# Altium project HDMI_To_FPCadaptor_V1.0.PrjPcb (part 1 of 2)
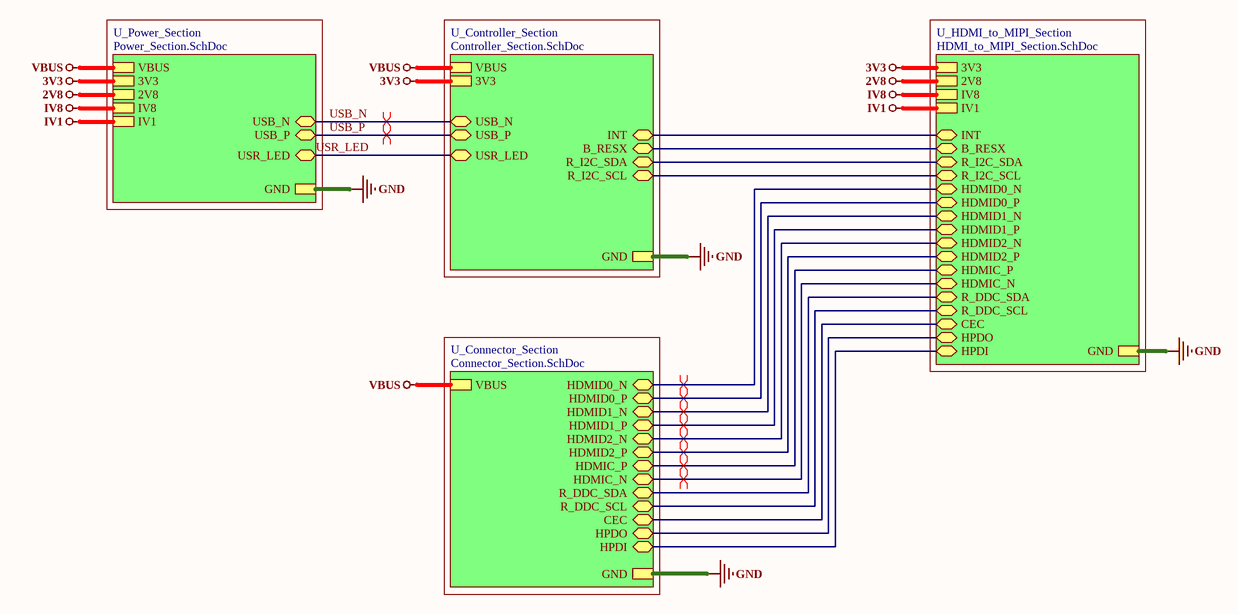
[diagram p0: Top_Sheet.SchDoc]
5 sheets, 121 parts. Net scope: hierarchical (ports join the sheet entries above them; power ports are global).
Board file: PCB_HDMI_To_FPC-v1.0.PcbDoc
Sheets:
  Top_Sheet.SchDoc
    U_Power_Section = Power_Section.SchDoc
    U_Connector_Section = Connector_Section.SchDoc
    U_Controller_Section = Controller_Section.SchDoc
    U_HDMI_to_MIPI_Section = HDMI_to_MIPI_Section.SchDoc

## Sheet Top_Sheet.SchDoc
size A4; SheetNumber: 1; SheetTotal: 5

### Sub-sheets
U_Connector_Section = Connector_Section.SchDoc: HDMID0_N (bidir), HDMID0_P (bidir), HDMID1_N (bidir), HDMID1_P (bidir), HDMID2_N (bidir), HDMID2_P (bidir), HDMIC_P (bidir), HDMIC_N (bidir), R_DDC_SDA (bidir), R_DDC_SCL (bidir), CEC (bidir), HPDO (bidir), HPDI (bidir), VBUS, GND
U_Controller_Section = Controller_Section.SchDoc: USB_N (bidir), USB_P (bidir), USR_LED (bidir), INT (bidir), B_RESX (bidir), R_I2C_SDA (bidir), R_I2C_SCL (bidir), 3V3, VBUS, GND
U_HDMI_to_MIPI_Section = HDMI_to_MIPI_Section.SchDoc: 3V3, GND, IV8, IV1, 2V8, INT (bidir), B_RESX (bidir), R_I2C_SDA (bidir), R_I2C_SCL (bidir), HDMID0_N (bidir), HDMID0_P (bidir), HDMID1_N (bidir), HDMID1_P (bidir), HDMID2_N (bidir), HDMID2_P (bidir), HDMIC_P (bidir), HDMIC_N (bidir), R_DDC_SDA (bidir), R_DDC_SCL (bidir), CEC (bidir), HPDO (bidir), HPDI (bidir)
U_Power_Section = Power_Section.SchDoc: 3V3, GND, VBUS, IV8, IV1, 2V8, USB_N (bidir), USB_P (bidir), USR_LED (bidir)

### Nets
2V8: sheet U_Power_Section/2V8, sheet U_HDMI_to_MIPI_Section/2V8
3V3: sheet U_Power_Section/3V3, sheet U_Controller_Section/3V3, sheet U_HDMI_to_MIPI_Section/3V3
GND: sheet U_Power_Section/GND, sheet U_Connector_Section/GND, sheet U_Controller_Section/GND, sheet U_HDMI_to_MIPI_Section/GND
IV1: sheet U_Power_Section/IV1, sheet U_HDMI_to_MIPI_Section/IV1
IV8: sheet U_Power_Section/IV8, sheet U_HDMI_to_MIPI_Section/IV8
VBUS: sheet U_Power_Section/VBUS, sheet U_Connector_Section/VBUS, sheet U_Controller_Section/VBUS
B_RESX: sheet U_Controller_Section/B_RESX, sheet U_HDMI_to_MIPI_Section/B_RESX
CEC: sheet U_Connector_Section/CEC, sheet U_HDMI_to_MIPI_Section/CEC
HDMIC_N: sheet U_Connector_Section/HDMIC_N, sheet U_HDMI_to_MIPI_Section/HDMIC_N
HDMIC_P: sheet U_Connector_Section/HDMIC_P, sheet U_HDMI_to_MIPI_Section/HDMIC_P
HDMID0_N: sheet U_Connector_Section/HDMID0_N, sheet U_HDMI_to_MIPI_Section/HDMID0_N
HDMID0_P: sheet U_Connector_Section/HDMID0_P, sheet U_HDMI_to_MIPI_Section/HDMID0_P
HDMID1_N: sheet U_Connector_Section/HDMID1_N, sheet U_HDMI_to_MIPI_Section/HDMID1_N
HDMID1_P: sheet U_Connector_Section/HDMID1_P, sheet U_HDMI_to_MIPI_Section/HDMID1_P
HDMID2_N: sheet U_Connector_Section/HDMID2_N, sheet U_HDMI_to_MIPI_Section/HDMID2_N
HDMID2_P: sheet U_Connector_Section/HDMID2_P, sheet U_HDMI_to_MIPI_Section/HDMID2_P
HPDI: sheet U_Connector_Section/HPDI, sheet U_HDMI_to_MIPI_Section/HPDI
HPDO: sheet U_Connector_Section/HPDO, sheet U_HDMI_to_MIPI_Section/HPDO
INT: sheet U_Controller_Section/INT, sheet U_HDMI_to_MIPI_Section/INT
R_DDC_SCL: sheet U_Connector_Section/R_DDC_SCL, sheet U_HDMI_to_MIPI_Section/R_DDC_SCL
R_DDC_SDA: sheet U_Connector_Section/R_DDC_SDA, sheet U_HDMI_to_MIPI_Section/R_DDC_SDA
R_I2C_SCL: sheet U_Controller_Section/R_I2C_SCL, sheet U_HDMI_to_MIPI_Section/R_I2C_SCL
R_I2C_SDA: sheet U_Controller_Section/R_I2C_SDA, sheet U_HDMI_to_MIPI_Section/R_I2C_SDA
USB_N: sheet U_Power_Section/USB_N, sheet U_Controller_Section/USB_N
USB_P: sheet U_Power_Section/USB_P, sheet U_Controller_Section/USB_P
USR_LED: sheet U_Power_Section/USR_LED, sheet U_Controller_Section/USR_LED

### Layout directives
differential pair; net class USB; differential pair class USB_Lines; rule Impedance Constraint [Min = 85.00    Max = 90.00    ]; rule Matched Net Lengths [Tolerance = 50mil]: USB_N, USB_P
differential pair; net class HDMI; differential pair class HDMI_Lines; rule Impedance Constraint [Min = 95.00    Max = 100.0    ]; rule Matched Net Lengths [Tolerance = 5mil]: HDMIC_N, HDMIC_P, HDMID0_N, HDMID0_P, HDMID1_N, HDMID1_P, HDMID2_N, HDMID2_P

### Notes on the sheet
- File:
- Title:
- Date:
- Page
- Num:
- Total:
- Drawn By: Huzaifa Ali

## Sheet Power_Section.SchDoc
size A4; SheetNumber: 2; SheetTotal: 5
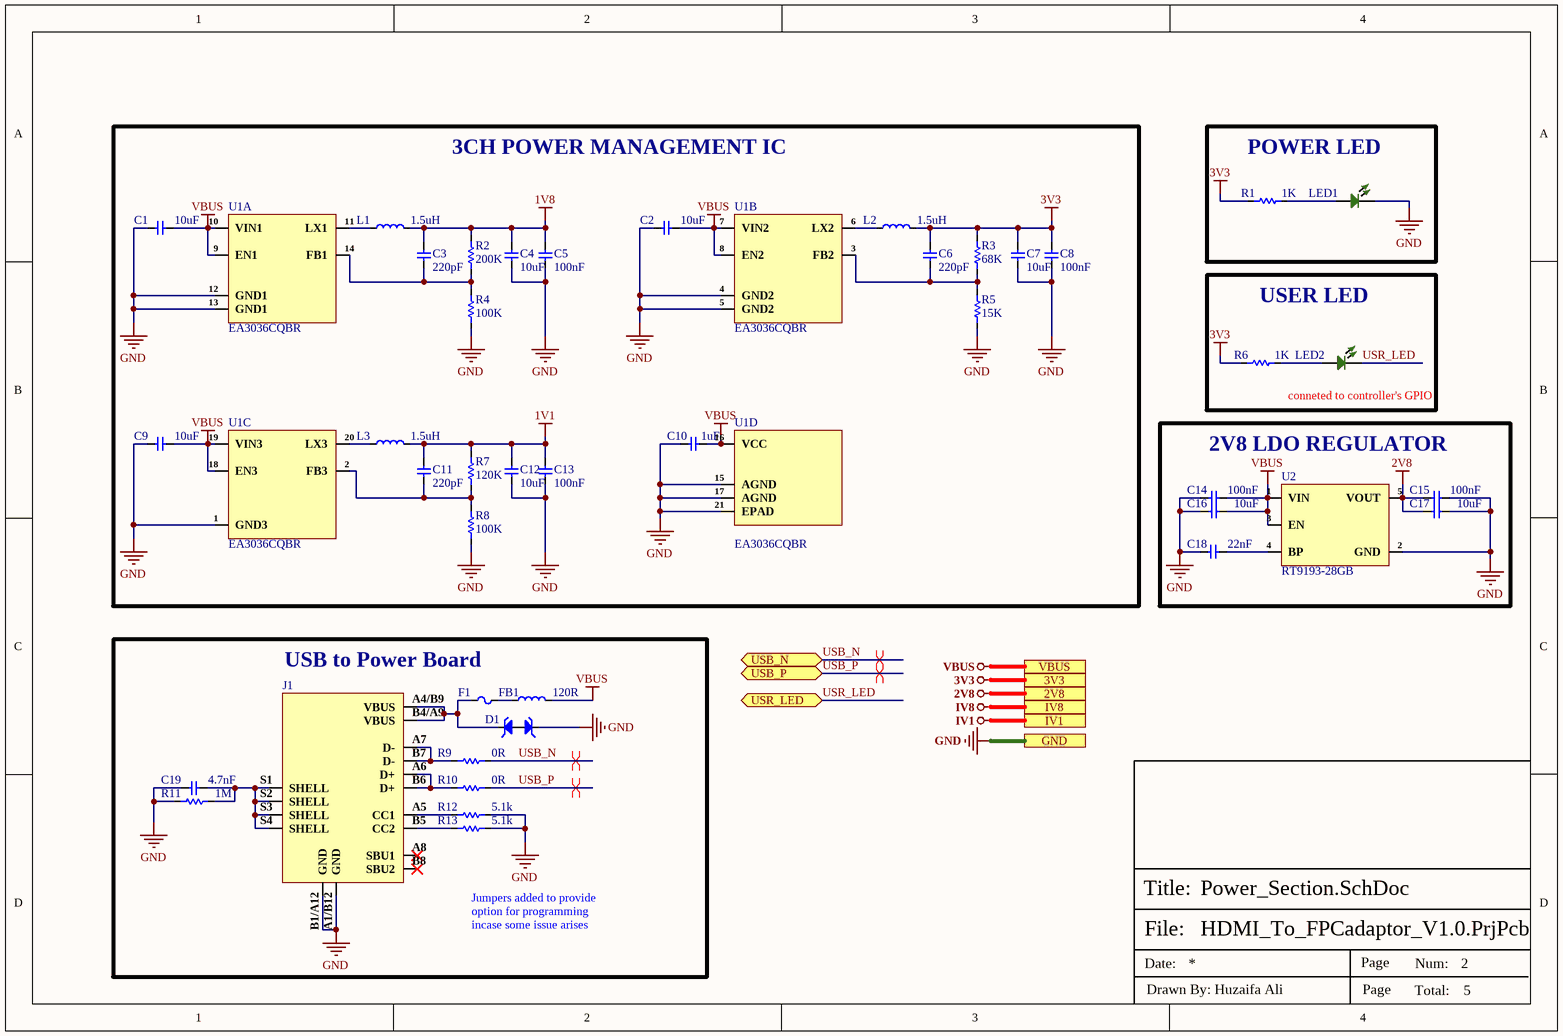
[diagram p1: Power_Section.SchDoc]

### Parts
C1  10uF  [Cap-0603]
C2  10uF  [Cap-0603]
C3  220pF  [Cap-0603]
C4  10uF  [Cap-0603]
C5  100nF  [Cap-0603]
C6  220pF  [Cap-0603]
C7  10uF  [Cap-0603]
C8  100nF  [Cap-0603]
C9  10uF  [Cap-0603]
C10  1uF  [Cap-0603]
C11  220pF  [Cap-0603]
C12  10uF  [Cap-0603]
C13  100nF  [Cap-0603]
C14  100nF  [Cap-0603]
C15  100nF  [Cap-0603]
C16  10uF  [Cap-0603]
C17  10uF  [Cap-0603]
C18  22nF  [Cap-0603]
C19  4.7nF  [Cap-0603]
D1  PESD5V0H1BSFYL  [DSN0603-2]  (value not drawn)
F1  1206L300SLTHYR  [Fuse 1206 (3216 Metric)]  (value not drawn)
FB1  120R  [IND-0603 (1608 Metric)]
J1  TYPE-C-31-M-12  [TYPE-C-31-M-12_]  (value not drawn)
L1  1.5uH  [IND-1008 (2520 Metric)]
L2  1.5uH  [IND-1008 (2520 Metric)]
L3  1.5uH  [IND-1008 (2520 Metric)]
LED1  Green  [LED-0402]  (value not drawn)
LED2  Green  [LED-0402]  (value not drawn)
R1  1K  [Res-0603]
R2  200K  [Res-0603]
R3  68K  [RES-0603]
R4  100K  [Res-0603]
R5  15K  [RES-0603]
R6  1K  [Res-0603]
R7  120K  [RES-0603]
R8  100K  [Res-0603]
R9  0R  [Res-0603]
R10  0R  [Res-0603]
R11  1M  [Res-0603]
R12  5.1k  [Res-0603]
R13  5.1k  [Res-0603]
U1  EA3036CQBR  [20-QFN(3x3)]  (parts A,B,C,D of 4)
U2  RT9193-28GB  [SOT-23-5]

### Blocks framed on the sheet
3CH POWER MANAGEMENT IC: C1-C13 L1-L3 R2-R5 R7 R8 U1
POWER LED: LED1 R1
USER LED: LED2 R6
2V8 LDO REGULATOR: C14-C18 U2
USB to Power Board: C19 D1 F1 FB1 J1 R9-R13

### Ports
2V8 (see Top_Sheet[1B], HDMI_to_MIPI_Section[1D]), 3V3 (see Top_Sheet[1B], Controller_Section[1D], HDMI_to_MIPI_Section[1D]), GND (see Top_Sheet[2B], Connector_Section[3C], Controller_Section[1D], HDMI_to_MIPI_Section[1D]), IV1 (see Top_Sheet[1B], HDMI_to_MIPI_Section[1D]), IV8 (see Top_Sheet[1B], HDMI_to_MIPI_Section[1D]), USB_N (bidir, see Top_Sheet[2B], Controller_Section[1C]), USB_P (bidir, see Top_Sheet[2B], Controller_Section[1C]), USR_LED (bidir, see Top_Sheet[2B], Controller_Section[1D]), VBUS (see Top_Sheet[1B], Connector_Section[3C], Controller_Section[1D])

### Nets
1V1: C11.2 C12.2 C13.2 L3.2 R7.2
1V8: C3.2 C4.2 C5.2 L1.2 R2.2
2V8: C15.2 C17.2 U2.5(VOUT) ; port 2V8
3V3: C6.2 C7.2 C8.2 L2.2 R1.1 R3.2 R6.1 ; port 3V3
GND: C1.1 C2.1 C4.1 C5.1 C7.1 C8.1 C9.1 C10.1 C12.1 C13.1 C14.2 C15.1 C16.2 C17.1 C18.1 C19.1 D1.2 J1.A1/B12(GND) J1.B1/A12(GND) LED1.2 R4.1 R5.1 R8.1 R11.1 R12.2 R13.2 U1.1(GND3) U1.4(GND2) U1.5(GND2) U1.12(GND1) U1.13(GND1) U1.15(AGND) U1.17(AGND) U1.21(EPAD) U2.2(GND) ; port GND
VBUS: C1.2 C2.2 C9.2 C10.2 C14.1 C16.1 FB1.2 U1.7(VIN2) U1.8(EN2) U1.9(EN1) U1.10(VIN1) U1.16(VCC) U1.18(EN3) U1.19(VIN3) U2.1(VIN) U2.3(EN) ; port VBUS
USB_N: R9.2 ; port USB_N
USB_P: R10.2 ; port USB_P
USR_LED: LED2.2 ; port USR_LED
NetC3_1: C3.1 R2.1 R4.2 U1.14(FB1)
NetC6_1: C6.1 R3.1 R5.2 U1.3(FB2)
NetC11_1: C11.1 R7.1 R8.2 U1.2(FB3)
NetC18_2: C18.2 U2.4(BP)
NetC19_2: C19.2 J1.S1(SHELL) J1.S2(SHELL) J1.S3(SHELL) J1.S4(SHELL) R11.2
NetD1_1: D1.1 F1.1 J1.A4/B9(VBUS) J1.B4/A9(VBUS)
NetF1_2: F1.2 FB1.1
NetJ1_A5: J1.A5(CC1) R12.1
NetJ1_A6: J1.A6(D+) J1.B6(D+) R10.1
NetJ1_A7: J1.A7(D-) J1.B7(D-) R9.1
NetJ1_B5: J1.B5(CC2) R13.1
NetL1_1: L1.1 U1.11(LX1)
NetL2_1: L2.1 U1.6(LX2)
NetL3_1: L3.1 U1.20(LX3)
NetLED1_1: LED1.1 R1.2
NetLED2_1: LED2.1 R6.2

Not connected (* = marked no-connect by the designer): J1 A8(SBU1)* B8(SBU2)*

### Layout directives
differential pair; net class USB; differential pair class USB_Lines; rule Impedance Constraint [Min = 85.00    Max = 90.00    ]; rule Matched Net Lengths [Tolerance = 50mil]: USB_N, USB_P

### Notes on the sheet
- conneted to controller's GPIO
- Jumpers added to provide option for programming incase some issue arises
- File:
- Title:
- Date:
- Page
- Num:
- Total:
- Drawn By: Huzaifa Ali

### Library data of the parts
C1 C2 C4 C7 C9 C12 C16 C17 = CGA0603X5R106K100JT: 10V 10uF X5R ±10% 0603 Multilayer Ceramic Capacitors MLCC - SMD/SMT ROHS; Manufacturer: HRE; ComponentLink1Description: LCSC; ComponentLink1URL: https://www.lcsc.com/product-detail/Multilayer-Ceramic-Capacitors-MLCC-SMD-SMT_HRE-CGA0603X5R106K100JT_C6119842.html; Manufacturer Part Number: CGA0603X5R106K100JT; Package: 0603; LCSC Part Number: C6119842; Item Type: Capacitor
C3 C6 C11 = CS1608X7R221K500NRB: 50V 220pF X7R ±10% 0603 Multilayer Ceramic Capacitors MLCC - SMD/SMT ROHS; Manufacturer: Samwha Capacitors; Manufacturer Part Number: CS1608X7R221K500NRB; Package: 0603; LCSC Part Number: C5255295; Item Type: Capacitor; ComponentLink1Description: LCSC; ComponentLink1URL: https://www.lcsc.com/product-detail/Multilayer-Ceramic-Capacitors-MLCC-SMD-SMT_Samwha-Capacitor-CS1608X7R221K500NRB_C5255295.html
C5 C8 C13-C15 = CL10B104KA8NNNC: 25V 100nF X7R ±10% 0603 Multilayer Ceramic Capacitors MLCC - SMD/SMT ROHS; Manufacturer: Samsung Electro-Mechanics; ComponentLink1Description: LCSC; ComponentLink1URL: https://www.lcsc.com/product-detail/Multilayer-Ceramic-Capacitors-MLCC-SMD-SMT_Samsung-Electro-Mechanics-CL10B104KA8NNNC_C1590.html; Manufacturer Part Number: CL10B104KA8NNNC; Package: 0603; LCSC Part Number: C1590; Item Type: Capacitor
C10 = CL10A105KO8NNNC: 16V 1uF X5R ±10% 0603 Multilayer Ceramic Capacitors MLCC - SMD/SMT ROHS; Manufacturer: Samsung Electro-Mechanics; Manufacturer Part Number: CL10A105KO8NNNC; Package: 0603; LCSC Part Number: C1592; Item Type: Capacitor; ComponentLink1Description: LCSC; ComponentLink1URL: https://www.lcsc.com/product-detail/Multilayer-Ceramic-Capacitors-MLCC-SMD-SMT_Samsung-Electro-Mechanics-CL10A105KO8NNNC_C1592.html
C18 = FN18X223K250PSG: 25V 22nF X7R 0603 Multilayer Ceramic Capacitors MLCC - SMD/SMT ROHS; Manfacuturer: PSA; Manufacturer Prt no: FN18X223K250PSG; Package: 0603; Value: 22nF; ComponentLink1Description: LCSC; ComponentLink1URL: https://www.lcsc.com/product-detail/Multilayer-Ceramic-Capacitors-MLCC-SMD-SMT_PSA-Prosperity-Dielectrics-FN18X223K250PSG_C2929161.html; Item Type: Capacitor; LCSC Part no: C2929161
C19 = CC0603JRNPO9BN472: CAP CER 4700PF 50V C0G/NPO 0603; Manufacturer: Yageo; Item Type: Capacitor; Supplier 1: Digi-Key; Manufacturer Part Number: CC0603JRNPO9BN472; RoHS: Yes; Category: Ceramic Capacitors; Stock 1: 31779; Pricing 1: 1=0.48000, 10=0.33000, 50=0.23100, 100=0.19800, 500=0.14854, 1000=0.12543 (USD); RoHS Compliant: Yes; Supplier Part Number 1: 13-CC0603JRNPO9BN472CT-ND; LCSC Part Number: C576818; ComponentLink1Description: LCSC; ComponentLink1URL: https://www.lcsc.com/product-detail/Multilayer-Ceramic-Capacitors-MLCC-SMD-SMT_YAGEO-CC0603JRNPO9BN472_C576818.html
D1 = PESD5V0H1BSFYL: TVS DIODE 5VWM 6.3VC DSN0603-2; Manufacturer: Nexperia; Supplier 1: Avnet; Manufacturer Part Number: PESD5V0H1BSFYL; RoHS: Yes; Category: ESD and Circuit Protection ICs; Stock 1: 9000; Pricing 1: 18000=0.06453, 36000=0.06278, 54000=0.06104, 90000=0.05930, 180000=0.05755, 900000=0.05581, 1800000=0.05406 (USD); RoHS Compliant: Yes; ComponentLink1URL: http://www.farnell.com/datasheets/1961312.pdf?src-supplier=Farnell; ComponentLink1Description: http://www.farnell.com/datasheets/1961312.pdf?src-supplier=Farnell; ComponentLink2URL: https://assets.nexperia.com/documents/data-sheet/PESD5V0H1BSF.pdf?src-supplier=Digi-Key; ComponentLink2Description: https://assets.nexperia.com/documents/data-sheet/PESD5V0H1BSF.pdf?src-supplier=Digi-Key; ComponentLink3URL: http://www.farnell.com/datasheets/1961312.pdf?src-supplier=Newark; ComponentLink3Description: http://www.farnell.com/datasheets/1961312.pdf?src-supplier=Newark; Supplier Part Number 1: PESD5V0H1BSFYL; LCSC Part Number: C477989; Item Type: Diode
F1 = 1206L300SLTHYR: PTC RESET FUSE 6V 3A 1206; Manufacturer: Littelfuse; Max Current Rating: 50A; Resistance: 20mR; Power Dissipation: 800mW; Trip Current: 6A; Time to Trip: 4s; Approvals: UL,TUV; Supplier 1: Arrow Electronics; Manufacturer Part Number: 1206L300SLTHYR; RoHS: Yes; Category: PTC Resettable Fuses; Stock 1: 4000; Pricing 1: 4000=0.60290 (USD); Case/Package: 1206; Case Code (Metric): 3216; Case Code (Imperial): 1206; Min Operating Temperature: -40°C; Max Operating Temperature: 85°C; Package Quantity: 4000; Packaging: Tape and Reel; Termination: SMD/SMT; Max Voltage Rating (DC): 6V; Hold Current: 3A; Voltage Rating (DC): 6V; Operating Supply Voltage: 6V; Series: POLY-FUSE®, LoRho™; Lead Free: Lead Free; RoHS Compliant: Yes; ComponentLink1URL: https://datasheet.ciiva.com/7438/littelfuse-lorho-ptc-7438567.pdf?src-supplier=Digi-Key; ComponentLink1Description: https://datasheet.ciiva.com/7438/littelfuse-lorho-ptc-7438567.pdf?src-supplier=Digi-Key; ComponentLink2URL: https://datasheet.ciiva.com/7438/littelfuse-lorho-ptc-7438569.pdf?src-supplier=Digi-Key; ComponentLink2Description: https://datasheet.ciiva.com/7438/littelfuse-lorho-ptc-7438569.pdf?src-supplier=Digi-Key; ComponentLink3URL: https://datasheet.ciiva.com/7438/littelfuse-lorho-ptc-7438565.pdf?src-supplier=Digi-Key; ComponentLink3Description: https://datasheet.ciiva.com/7438/littelfuse-lorho-ptc-7438565.pdf?src-supplier=Digi-Key; Supplier Part Number 1: 1206L300SLTHYR; LCSC Part Number: C207041; Item Type: Fuse
FB1 = BLM18PG121SN1D: Ferrite Beads Multi-Layer 120Ohm 25% 100MHz 2A 50mOhm DCR 0603 Paper T/R; Manufacturer: Murata Electronics; Material: Steel,Ferrite; Number of Lines: 1; DC Resistance (DCR): 50mR; Shielding: Unshielded; Manufacturer Part Number: BLM18PG121SN1D; Package: 0603; LCSC Part Number: C14709; Item Type: Ferrite Bead; ComponentLink1Description: LCSC; ComponentLink1URL: https://www.lcsc.com/product-detail/Ferrite-Beads_Murata-Electronics-BLM18PG121SN1D_C14709.html; Supplier: Digikey; Supplier Part Number: 490-1037-1-ND; RoHS: Yes; Category: Ferrite Beads and Chips; Stock: 1240; Pricing: 1=0.1, 10=0.078, 25=0.0712, 50=0.064, 100=0.0469, 250=0.03412, 500=0.03128, 1000=0.02701 (USD); Case/Package: 0603; Pins: 2; Core Material: Ferrite; Case Code (Metric): 1608; Case Code (Imperial): 0603; Min Operating Temperature: -55°C; Max Operating Temperature: 125°C; Tolerance: 25%; Impedance: 120R; Package Quantity: 1; Max Current Rating: 2A; Packaging: Tape and Reel; Current Rating: 2A; Max DC Current: 2A; Termination: SMD/SMT; Test Frequency: 100MHz; DC Current: 2A; Frequency: 100MHz; Number of Circuits: 1; Series: BLM18P; DC Resistance-Max: 50mR; RMS Current (Irms): 2A; ESR: 50mR; Length: 1.6mm; Width: 0.8mm; Height: 0.8mm; Depth: 0.8mm; Radiation Hardening: No; Reach SVHC Compliant: No; Lead Free: Lead Free; RoHS Compliant: Yes; ComponentLink2URL: https://datasheet.ciiva.com/5709/1740433-5709171.pdf?src-supplier=Farnell; ComponentLink2Description: https://datasheet.ciiva.com/5709/1740433-5709171.pdf?src-supplier=Farnell; ComponentLink3URL: https://datasheet.ciiva.com/19454/1845013-19454715.pdf?src-supplier=Jameco; ComponentLink3Description: https://datasheet.ciiva.com/19454/1845013-19454715.pdf?src-supplier=Jameco; ComponentLink4URL: https://datasheet.ciiva.com/11799/0900766b81275ca5-11799546.pdf?src-supplier=Rs; ComponentLink4Description: https://datasheet.ciiva.com/11799/0900766b81275ca5-11799546.pdf?src-supplier=Rs; ComponentLink5URL: https://datasheet.ciiva.com/3854/5emiapbde-1-3854039.pdf?src-supplier=Arrow+Electronics; ComponentLink5Description: https://datasheet.ciiva.com/3854/5emiapbde-1-3854039.pdf?src-supplier=Arrow+Electronics; ComponentLink6URL: https://datasheet.ciiva.com/29347/442365-da-01-en-chip-drossel-0603-120r-2000ma-1-6x0-8mm-29347911.pdf?src-supplier=Conrad; ComponentLink6Description: https://datasheet.ciiva.com/29347/442365-da-01-en-chip-drossel-0603-120r-2000ma-1-6x0-8mm-29347911.pdf?src-supplier=Conrad; ComponentLink7URL: https://datasheet.ciiva.com/8021/1740433-8021493.pdf?src-supplier=Element14; ComponentLink7Description: https://datasheet.ciiva.com/8021/1740433-8021493.pdf?src-supplier=Element14; ComponentLink8URL: https://datasheet.ciiva.com/8021/1740433-8021494.pdf?src-supplier=Element14; ComponentLink8Description: https://datasheet.ciiva.com/8021/1740433-8021494.pdf?src-supplier=Element14; ComponentLink9URL: https://datasheet.ciiva.com/14122/blm-series-eng-tds-14122905.pdf?src-supplier=Distrelec; ComponentLink9Description: https://datasheet.ciiva.com/14122/blm-series-eng-tds-14122905.pdf?src-supplier=Distrelec; ComponentLink10URL: https://datasheet.ciiva.com/6212/l0110s0100blm18p-6212502.pdf?src-supplier=Digikey; ComponentLink10Description: https://datasheet.ciiva.com/6212/l0110s0100blm18p-6212502.pdf?src-supplier=Digikey; ComponentLink11URL: https://datasheet.ciiva.com/6212/l0110s0100blm18p-6212504.pdf?src-supplier=Digikey; ComponentLink11Description: https://datasheet.ciiva.com/6212/l0110s0100blm18p-6212504.pdf?src-supplier=Digikey; ComponentLink12URL: https://datasheet.ciiva.com/3081/l0110s0100blm18p-3081632.pdf?src-supplier=Avnet; ComponentLink12Description: https://datasheet.ciiva.com/3081/l0110s0100blm18p-3081632.pdf?src-supplier=Avnet; ComponentLink13URL: https://datasheet.ciiva.com/41449/001172297-da-01-en-drossel-0603-120r-1-6x0-8mm-4000st-41449659.pdf?src-supplier=Conrad; ComponentLink13Description: https://datasheet.ciiva.com/41449/001172297-da-01-en-drossel-0603-120r-1-6x0-8mm-4000st-41449659.pdf?src-supplier=Conrad
J1 = TYPE-C-31-M-12: 5A 1 16P Female Type-C SMD USB Connectors ROHS /; Manufacturer: Korean Hroparts Elec; ComponentLink1Description: LCSC; ComponentLink1URL: https://www.lcsc.com/product-detail/USB-Connectors_Korean-Hroparts-Elec-TYPE-C-31-M-12_C165948.html; Manufacturer Part Number: TYPE-C-31-M-12; Footprint: Custom; LCSC Part Number: C165948; Item Type: USB Connector
L1-L3 = LQM2HPN1R5MG0L: Inductor Power Chip Shielded Multi-Layer 1.5uH 20% 1MHz Ferrite 1.5A 0.088Ohm DCR 1008 T/R; Manufacturer: Murata Electronics; Self Resonant Frequency: 50MHz; DC Resistance (DCR): 88mR; Manufacturer Part Number: LQM2HPN1R5MG0L; Package: 1008; LCSC Part Number: C98034; Item Type: Inductor; ComponentLink1Description: LCSC; ComponentLink1URL: https://www.lcsc.com/product-detail/Inductors-SMD_Murata-Electronics-LQM2HPN1R5MG0L_C98034.html; Supplier: Digikey; Supplier Part Number: 490-5113-1-ND; RoHS: Yes; Category: Fixed Inductors; Stock: 55189; Pricing: 1=0.21, 10=0.171, 25=0.1576, 50=0.1444, 100=0.1274, 250=0.12344, 500=0.11032, 1000=0.0893 (USD); Mounting Technology: Surface Mount; Case/Package: 1008; Core Material: Ferrite; Case Code (Metric): 2520; Case Code (Imperial): 1008; Min Operating Temperature: -55°C; Max Operating Temperature: 125°C; Tolerance: 20%; Packaging: Tape and Reel; Shielding: Shielded; Package Quantity: 1; Current Rating: 1.5A; Value: 1.5uH; Test Frequency: 1MHz; Max DC Current: 1.5A; Termination: SMD/SMT; DC Current: 1.5A; Inductance Tolerance: 20%; Series: LQM2HP_G0; RMS Current (Irms): 1.5A; ESR: 88mR; Length: 2.5mm; Width: 0.079inch; Height: 1.2mm; Height - Seated (Max): 0.039inch; Depth: 2.2mm; Radiation Hardening: No; Military Standard: Not; Reach SVHC Compliant: No; Lead Free: Lead Free; RoHS Compliant: Yes; ComponentLink2URL: https://datasheet.ciiva.com/30490/0900766b812561d9-30490182.pdf?src-supplier=Rs; ComponentLink2Description: https://datasheet.ciiva.com/30490/0900766b812561d9-30490182.pdf?src-supplier=Rs; ComponentLink3URL: https://datasheet.ciiva.com/1042/l0075s0104lqm2hp-g0-1042938.pdf?src-supplier=Digikey; ComponentLink3Description: https://datasheet.ciiva.com/1042/l0075s0104lqm2hp-g0-1042938.pdf?src-supplier=Digikey; ComponentLink4URL: https://datasheet.ciiva.com/1042/l0075s0104lqm2hp-g0-1042937.pdf?src-supplier=Digikey; ComponentLink4Description: https://datasheet.ciiva.com/1042/l0075s0104lqm2hp-g0-1042937.pdf?src-supplier=Digikey; ComponentLink5URL: https://datasheet.ciiva.com/1042/l0075s0104lqm2hp-g0-1042939.pdf?src-supplier=Digikey; ComponentLink5Description: https://datasheet.ciiva.com/1042/l0075s0104lqm2hp-g0-1042939.pdf?src-supplier=Digikey; ComponentLink6URL: https://datasheet.ciiva.com/8510/l0075s0104lqm2hp-g0-8510490.pdf?src-supplier=Avnet; ComponentLink6Description: https://datasheet.ciiva.com/8510/l0075s0104lqm2hp-g0-8510490.pdf?src-supplier=Avnet
LED1 LED2 = 16-213/GHC-YR1S1/3T: Green 520~535nm 0402 Light Emitting Diodes (LED) RoHS; Manufacturer: Everlight Elec; Luminous Intensity (IF=20mA): 112~285mcd; Package: 0402; Illumination Color: Green; Dominant Wavelength / Coordinate rank: 520~535nm; Mounting Type: Surface Mount; Manufacturer Part Number: 16-213/GHC-YR1S1/3T; ComponentLink1Description: LCSC; ComponentLink1URL: https://www.lcsc.com/product-detail/Light-Emitting-Diodes-LED_Everlight-Elec-16-213-GHC-YR1S1-3T_C74338.html; LCSC Part Number: C74338; Item Type: LED
R1 R6 = RC0603FR-071KL: RES SMD 1K OHM 1% 1/10W 0603; Manufacturer: Yageo; Resistance: 1kR; Temperature Coefficient: 100ppm/°C; Power Rating: 100mW; Voltage Rating: 50V; Item type: Resistor; ComponentLink1URL: https://www.verical.com/server-webapp/html/getDatasheet?partID=409289&src-supplier=Verical; ComponentLink1Description: https://www.verical.com/server-webapp/html/getDatasheet?partID=409289&src-supplier=Verical; Supplier 1: Digi-Key; Manufacturer Part Number: RC0603FR-071KL; Stock 1: 21472395; Pricing 1: 1=0.1, 10=0.023, 100=0.0094, 1000=0.0042, 2500=0.0037 (USD); Case/Package: 0603; Contact Plating: Tin,Matte; Case Code (Imperial): 0603; Case Code (Metric): 1608; Min Operating Temperature: -55°C; Max Operating Temperature: 155°C; Tolerance: 1%; Composition: Thick Film; Packaging: Tape and Reel; Termination: SMD/SMT; Military Standard: Not; Length: 1.6mm; Height: 0.45mm; Depth: 0.8mm; Radiation Hardening: No; REACH SVHC: No SVHC; Lead Free: Lead Free; ComponentLink2URL: http://documents.rs-components.com/techlib://itc_doclist_GB.htm?stockno=5048928&src-supplier=RSComponents; ComponentLink2Description: http://documents.rs-components.com/techlib://itc_doclist_GB.htm?stockno=5048928&src-supplier=RSComponents; ComponentLink3URL: http://www.yageo.com/documents/recent/PYu-RC0603_51_RoHS_L_4.pdf?src-supplier=Avnet+Europe; ComponentLink3Description: http://www.yageo.com/documents/recent/PYu-RC0603_51_RoHS_L_4.pdf?src-supplier=Avnet+Europe; ComponentLink4URL: http://www.farnell.com/datasheets/2167052.pdf?src-supplier=Element14; ComponentLink4Description: http://www.farnell.com/datasheets/2167052.pdf?src-supplier=Element14; ComponentLink5URL: http://www.farnell.com/datasheets/1868787.pdf?src-supplier=Element14; ComponentLink5Description: http://www.farnell.com/datasheets/1868787.pdf?src-supplier=Element14; ComponentLink6URL: http://www.yageo.com/documents/recent/PYu-RC_Group_51_RoHS_L_2.pdf?src-supplier=Avnet; ComponentLink6Description: http://www.yageo.com/documents/recent/PYu-RC_Group_51_RoHS_L_2.pdf?src-supplier=Avnet; ComponentLink7URL: https://www.verical.com/server-webapp/html/getDatasheet?partID=404327&src-supplier=Verical; ComponentLink7Description: https://www.verical.com/server-webapp/html/getDatasheet?partID=404327&src-supplier=Verical; ComponentLink8URL: http://www.farnell.com/datasheets/443971.pdf?src-supplier=Element14; ComponentLink8Description: http://www.farnell.com/datasheets/443971.pdf?src-supplier=Element14; Supplier Part Number 1: 311-1.00KHRDKR-ND; LCSC Part Number: C22548
R2 = 0603WAF2003T5E: 100mW Thick Film Resistors 75V ±100ppm/℃ ±1% 200kΩ 0603 Chip Resistor - Surface Mount ROHS; Manufacturer: UNI-ROYAL(Uniroyal Elec); Manufacturer Part Number: 0603WAF2003T5E; LCSC Part Number: C25811; Package: 0603; Item Type: Resistor; ComponentLink1Description: LCSC; ComponentLink1URL: https://www.lcsc.com/product-detail/Chip-Resistor-Surface-Mount_UNI-ROYAL-Uniroyal-Elec-0603WAF2003T5E_C25811.html
R3 = 0603WAF6802T5E: 100mW Thick Film Resistors 75V ±100ppm/℃ ±1% 68kΩ 0603 Chip Resistor - Surface Mount ROHS; Manufacturer: UNI-ROYAL(Uniroyal Elec); Manufacturer Part Number: 0603WAF6802T5E; Package: 0603; ComponentLink1Description: LCSC; ComponentLink1URL: https://www.lcsc.com/product-detail/Chip-Resistor-Surface-Mount_UNI-ROYAL-Uniroyal-Elec-0603WAF6802T5E_C23231.html; LCSC Part Number: C23231; Item Type: Resistor
R4 R8 = 0603WAF1003T5E: 100mW Thick Film Resistors 75V ±100ppm/℃ ±1% 100kΩ 0603 Chip Resistor - Surface Mount ROHS; Manufacturer: UNI-ROYAL; Manufacturer Part Number: 0603WAF1003T5E; Package: 0603; LCSC Part Number: C25803; Item Type: Resistor; ComponentLink1Description: LCSC; ComponentLink1URL: https://www.lcsc.com/product-detail/Chip-Resistor-Surface-Mount_UNI-ROYAL-Uniroyal-Elec-0603WAF1003T5E_C25803.html
R5 = FRC0603F1502TS: 100mW Thick Film Resistors 75V ±100ppm/℃ ±1% 15kΩ 0603 Chip Resistor - Surface Mount ROHS; Manufacturer: FOJAN; Manufacturer Part Number: FRC0603F1502TS; Package: 0603; ComponentLink1Description: LCSC; ComponentLink1URL: https://www.lcsc.com/product-detail/Chip-Resistor-Surface-Mount_FOJAN-FRC0603F1502TS_C2906995.html; LCSC Part Number: C2906995; Item Type: Resistor
R7 = 0603WAF1203T5E: 100mW Thick Film Resistors 75V ±100ppm/℃ ±1% 120kΩ 0603 Chip Resistor - Surface Mount ROHS; Manufacturer: UNI-ROYAL(Uniroyal Elec); Manufacturer Part Number: 0603WAF1203T5E; Package: 0603; ComponentLink1Description: LCSC; ComponentLink1URL: https://www.lcsc.com/product-detail/Chip-Resistor-Surface-Mount_UNI-ROYAL-Uniroyal-Elec-0603WAF1203T5E_C25808.html; LCSC Part Number: C25808; Item Type: Resistor
R9 R10 = RC0603JR-070RL: RES 0 OHM JUMPER 1/10W 0603; Manufacturer: Yageo; Resistance: 0mR; Tolerance: 1%; Power Rating: 100mW; Voltage Rating (DC): 50V; Temperature Coefficient: 200ppm/°C; Resistance Tolerance: 5%; Item Type: Resistor; Supplier 1: Digi-Key; Manufacturer Part Number: RC0603JR-070RL; RoHS: Yes; Category: Chip SMD Resistors; Stock 1: 18081776; Pricing 1: 1=0.10000, 10=0.01700, 25=0.01240, 50=0.00960, 100=0.00700, 250=0.00536, 500=0.00430, 1000=0.00316 (USD); Case/Package: 0603; Number of Pins: 2; Contact Plating: Tin,Matte; Case Code (Imperial): 0603; Case Code (Metric): 1608; Size Code: 0603; Min Operating Temperature: -55°C; Max Operating Temperature: 155°C; Resistor Type: Thick Film; Packaging: Tape and Reel; Termination: SMD/SMT; Series: RC; Technology: THICK FILM; Package Quantity: 5000; Voltage Rating: 50V; Features: Moisture Resistant; Max Power Dissipation: 100mW; Number of Terminations: 2; Construction: Rectangular; Length: 1.6mm; Width: 0.8mm; Height: 0.45mm; Depth: 0.8mm; Radiation Hardening: No; Reach SVHC Compliant: No SVHC; Lead Free: Lead Free; RoHS Compliant: Yes; Military Standard: Not; Supplier Part Number 1: 311-0.0GRCT-ND; LCSC Part Number: C95177
R11 = 0603WAF1004T5E: 100mW Thick Film Resistors ±100ppm/℃ ±1% 1MΩ 0603 Chip Resistor - Surface Mount ROHS; Manufacturer: UNI-ROYAL(Uniroyal Elec); Manfacturer Part Number: 0603WAF1004T5E; LCSC Part Number: C22935; Package: 0603; Item Type: Resistor
R12 R13 = 0603WAF5101T5E: 100mW Thick Film Resistors 75V ±100ppm/℃ ±1% 5.1kΩ 0603 Chip Resistor - Surface Mount ROHS; Manufacturer: UNI-ROYAL; Footpint: 0603; Manufacturer Part Number: 0603WAF5101T5E; Value: 5.1k; ComponentLink1Description: LCSC; ComponentLink1URL: https://www.lcsc.com/product-detail/Chip-Resistor-Surface-Mount_UNI-ROYAL-Uniroyal-Elec-0603WAF5101T5E_C23186.html; LCSC Part Number: C23186; Item Type: Resistor
U1 = EA3036CQBR: 2.7V~5.5V 3 WQFN-20-EP(3x3) Battery Management ICs ROHS; Manufacturer: Everanalog IC Design; Item Type: IC; Manufacturer Part Number: EA3036CQBR; Package: WQFN-20-EP(3x3); LCSC Part Number: C570857; ComponentLink1Description: LCSC; ComponentLink1URL: https://www.lcsc.com/product-detail/Battery-Management-ICs_Everanalog-IC-design-EA3036CQBR_C570857.html
U2 = RT9193-28GB: IC REG LDO 2.8V 0.3A SOT23-5; Manufacturer: Richtek; Dropout Voltage: 220mV; Max Supply Voltage: 5.5V; Min Input Voltage: 2.5V; Max Output current: 300mA; Number of Regulators: 1; Min Current Limit: 360mA; Item Type: IC; LCSC Part Number: C56731; Supplier: Digikey; Supplier Part Number: 1028-1072-1-ND; Manufacturer Part Number: RT9193-28GB; RoHS: Yes; Category: Voltage Regulators - Linear; Stock: 1346; Pricing: 1=0.53, 10=0.454, 25=0.424, 100=0.3394, 250=0.31512, 500=0.26664, 1000=0.20604 (USD); Mounting Technology: Surface Mount; Case/Package: SOT-23-5; Pins: 5; Min Operating Temperature: -40°C; Max Operating Temperature: 125°C; Packaging: Cut Tape; Nominal Output Voltage: 2.8V; Output Current: 300mA; Output Voltage: 2.8V; Series: -; Lead Free: Lead Free; RoHS Compliant: Yes; Reach SVHC Compliant: Unknown; ComponentLink1URL: https://datasheet.ciiva.com/22686/1720535-22686400.pdf?src-supplier=Element14; ComponentLink1Description: https://datasheet.ciiva.com/22686/1720535-22686400.pdf?src-supplier=Element14; ComponentLink2URL: https://datasheet.ciiva.com/24157/rt9193-28gb-24157638.pdf?src-supplier=Future+Electronics; ComponentLink2Description: https://datasheet.ciiva.com/24157/rt9193-28gb-24157638.pdf?src-supplier=Future+Electronics

## Sheet Connector_Section.SchDoc
size A4; SheetNumber: 5; SheetTotal: 5
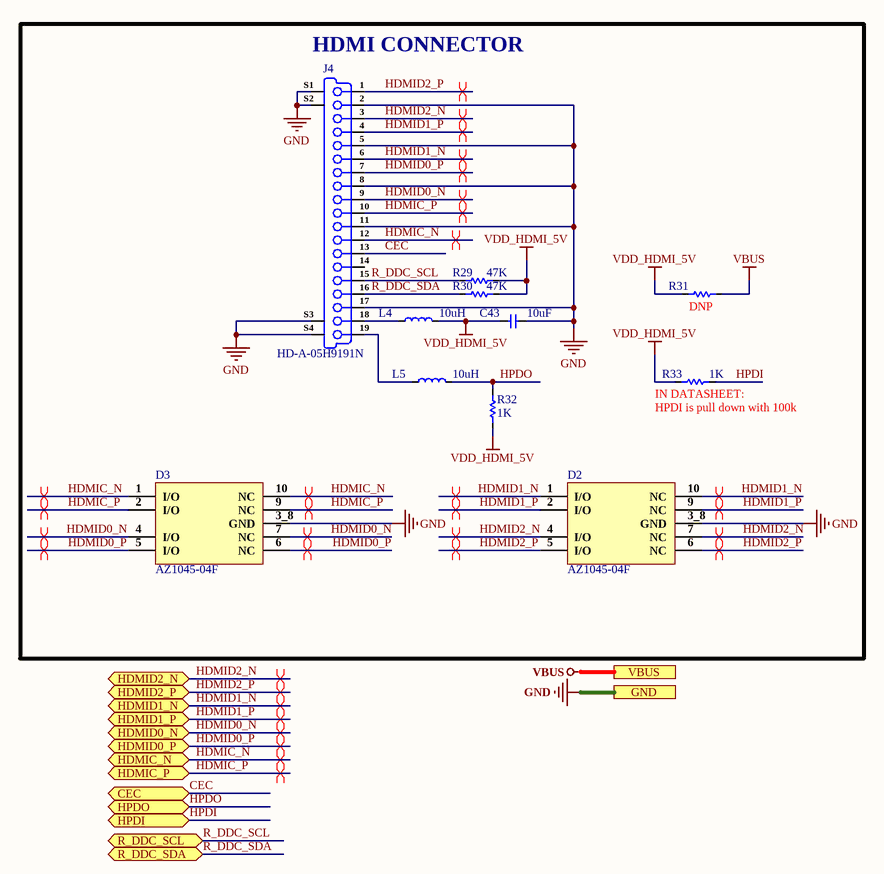
[diagram p2: Connector_Section.SchDoc]

### Parts
C43  10uF  [Cap-0603]
D2  AZ1045-04F  [AZ1045-04F]
D3  AZ1045-04F  [AZ1045-04F]
J4  HD-A-05H9191N  [HD-A-05H9191N]
L4  10uH  [IND-0603 (1608 Metric)]
L5  10uH  [IND-0603 (1608 Metric)]
R29  47K  [Res-0603]
R30  47K  [Res-0603]
R31  1K  [Res-0603]  (value not drawn)
R32  1K  [Res-0603]
R33  1K  [Res-0603]

### Ports
CEC (bidir, see Top_Sheet[3C], HDMI_to_MIPI_Section[1D]), GND (see Top_Sheet[3D], Controller_Section[1D], HDMI_to_MIPI_Section[1D], Power_Section[3C]), HDMIC_N (bidir, see Top_Sheet[3C], HDMI_to_MIPI_Section[1C]), HDMIC_P (bidir, see Top_Sheet[3C], HDMI_to_MIPI_Section[1D]), HDMID0_N (bidir, see Top_Sheet[3C], HDMI_to_MIPI_Section[1C]), HDMID0_P (bidir, see Top_Sheet[3C], HDMI_to_MIPI_Section[1C]), HDMID1_N (bidir, see Top_Sheet[3C], HDMI_to_MIPI_Section[1C]), HDMID1_P (bidir, see Top_Sheet[3C], HDMI_to_MIPI_Section[1C]), HDMID2_N (bidir, see Top_Sheet[3C], HDMI_to_MIPI_Section[1C]), HDMID2_P (bidir, see Top_Sheet[3C], HDMI_to_MIPI_Section[1C]), HPDI (bidir, see Top_Sheet[3C], HDMI_to_MIPI_Section[1D]), HPDO (bidir, see Top_Sheet[3C], HDMI_to_MIPI_Section[1D]), R_DDC_SCL (bidir, see Top_Sheet[3C], HDMI_to_MIPI_Section[1D]), R_DDC_SDA (bidir, see Top_Sheet[3C], HDMI_to_MIPI_Section[1D]), VBUS (see Top_Sheet[2C], Controller_Section[1D], Power_Section[3C])

### Nets
GND: C43.1 D2.3_8(GND) D3.3_8(GND) J4.2 J4.5 J4.8 J4.11 J4.17 J4.S1(Shield) J4.S2(Shield) J4.S3(Shield) J4.S4(Shield) ; port GND
VBUS: R31.1 ; port VBUS
VDD_HDMI_5V: C43.2 L4.2 R29.2 R30.2 R31.2 R32.2 R33.2
CEC: J4.13 ; port CEC
HDMIC_N: D3.1(I/O) D3.10(NC) J4.12 ; port HDMIC_N
HDMIC_P: D3.2(I/O) D3.9(NC) J4.10 ; port HDMIC_P
HDMID0_N: D3.4(I/O) D3.7(NC) J4.9 ; port HDMID0_N
HDMID0_P: D3.5(I/O) D3.6(NC) J4.7 ; port HDMID0_P
HDMID1_N: D2.1(I/O) D2.10(NC) J4.6 ; port HDMID1_N
HDMID1_P: D2.2(I/O) D2.9(NC) J4.4 ; port HDMID1_P
HDMID2_N: D2.4(I/O) D2.7(NC) J4.3 ; port HDMID2_N
HDMID2_P: D2.5(I/O) D2.6(NC) J4.1 ; port HDMID2_P
HPDI: R33.1 ; port HPDI
HPDO: L5.2 R32.1 ; port HPDO
R_DDC_SCL: J4.15 R29.1 ; port R_DDC_SCL
R_DDC_SDA: J4.16 R30.1 ; port R_DDC_SDA
NetJ4_18: J4.18 L4.1
NetJ4_19: J4.19 L5.1

Not connected (* = marked no-connect by the designer): J4 14

### Layout directives
differential pair; net class HDMI; differential pair class HDMI_Lines; rule Impedance Constraint [Min = 95.00    Max = 100.0    ]; rule Matched Net Lengths [Tolerance = 5mil]: HDMIC_N, HDMIC_P, HDMID0_N, HDMID0_P, HDMID1_N, HDMID1_P, HDMID2_N, HDMID2_P

### Notes on the sheet
- (near J4) HDMI CONNECTOR
- (near R31) DNP
- (near R33) IN DATASHEET:
- (near R33) HPDI is pull down with 100k
- File:
- Title:
- Date:
- Page
- Num:
- Total:
- Drawn By: Huzaifa Ali

### Library data of the parts
C43 = CGA0603X5R106K100JT: as C1 on sheet Power_Section; ComponentLink1Description: LCSC; ComponentLink1URL: https://www.lcsc.com/product-detail/Multilayer-Ceramic-Capacitors-MLCC-SMD-SMT_HRE-CGA0603X5R106K100JT_C6119842.html; Manufacturer Part Number: CGA0603X5R106K100JT; Package: 0603; LCSC Part Number: C6119842; Item Type: Capacitor
D2 D3 = AZ1045-04F: DFN2510-10 Electrostatic and Surge Protection (TVS/ESD) ROHS; Manufacturer: TECH PUBLIC; Item Type: Diode; ComponentLink1Description: LCSC; ComponentLink1URL: https://www.lcsc.com/product-detail/Electrostatic-and-Surge-Protection-TVS-ESD_TECH-PUBLIC-AZ1045-04F_C2987152.html; Manufacturer Part Number: AZ1045-04F; LCSC Part Number: C2987152
J4 = HD-A-05H9191N: 19P Female HDMI Surface Mount，Right Angle 1 500mA -45℃~+85℃ SMD D-Sub/DVI/HDMI Connectors ROHS; Manufacturer: HanElectricity; Manufacturer Part Number: HD-A-05H9191N; Package: SMD; LCSC Part Number: C18213861; Item Type: HDMI; ComponentLink1Description: LCSC; ComponentLink1URL: https://www.lcsc.com/product-detail/D-Sub-DVI-HDMI-Connectors_HanElectricity-HD-A-05H9191N_C18213861.html
L4 L5 = MCL1608S100MT: 50mA 10uH ±20% 1.17Ω 0603 Inductors (SMD) ROHS; Manufacturer: SUNLORD; Manufacturer Part Number: MCL1608S100MT; Value: 10uH; Footprint: 0603; ComponentLink1Description: LCSC; ComponentLink1URL: https://www.lcsc.com/product-detail/Inductors-SMD_Sunlord-MCL1608S100MT_C51942.html; LCSC Part Number: C51942
R29 R30 = RC0603JR-0747KL: RES 47K OHM 5% 1/10W 0603; Manufacturer: Yageo; Resistance: 47kR; Power Rating: 100mW; Voltage Rating (DC): 50V; Temperature Coefficient: 100ppm/°C; Resistance Tolerance: 1%; Supplier 1: Arrow; Manufacturer Part Number: RC0603JR-0747KL; Stock 1: 599135; Pricing 1: 5000=0.0025, 10000=0.0022, 25000=0.0019, 1=0.0011, 6000=0.001 (USD); Case/Package: 0603; Number of Pins: 2; Case Code (Imperial): 0603; Case Code (Metric): 1608; Min Operating Temperature: -55°C; Max Operating Temperature: 155°C; Packaging: Tape and Reel; Tolerance: 5%; Voltage Rating: 50V; Package Quantity: 5000; Termination: SMD/SMT; Military Standard: Not; Composition: Thick Film; Length: 1.6mm; Height: 0.45mm; Width: 0.8mm; Depth: 0.8mm; REACH SVHC: No SVHC; Lead Free: Lead Free; ComponentLink1URL: http://www.farnell.com/datasheets/443971.pdf; ComponentLink1Description: http://www.farnell.com/datasheets/443971.pdf; ComponentLink2URL: http://www.mouser.com/catalog/specsheets/RC0603.pdf; ComponentLink2Description: http://www.mouser.com/catalog/specsheets/RC0603.pdf; Supplier Part Number 1: RC0603JR-0747KL; Supplier 2: Digi-Key; RoHS: Yes; Category: Chip SMD Resistors; Stock 2: 1087850; Pricing 2: 1=0.10000, 10=0.02300, 100=0.00930, 1000=0.00417, 2500=0.00362 (USD); Size Code: 0603; Number of Terminations: 2; Resistor Type: Thick Film; Features: Moisture Resistant; Series: RC; Max Power Dissipation: 100mW; Construction: Rectangular; RoHS Compliant: Yes; ComponentLink3URL: https://datasheet.ciiva.com/46395/443971-46395003.pdf?src-supplier=Element14; ComponentLink3Description: https://datasheet.ciiva.com/46395/443971-46395003.pdf?src-supplier=Element14; ComponentLink4URL: https://datasheet.ciiva.com/12558/rc0603-272842-12558744.pdf?src-supplier=Mouser; ComponentLink4Description: https://datasheet.ciiva.com/12558/rc0603-272842-12558744.pdf?src-supplier=Mouser; Supplier Part Number 2: 311-30.0KHRCT-ND; LCSC Part Number: C127447
R31-R33 = RC0603FR-071KL: as R1 on sheet Power_Section; ComponentLink1URL: https://www.verical.com/server-webapp/html/getDatasheet?partID=409289&src-supplier=Verical; ComponentLink1Description: https://www.verical.com/server-webapp/html/getDatasheet?partID=409289&src-supplier=Verical; Supplier 1: Digi-Key; Manufacturer Part Number: RC0603FR-071KL; Stock 1: 21472395; Pricing 1: 1=0.1, 10=0.023, 100=0.0094, 1000=0.0042, 2500=0.0037 (USD); Case/Package: 0603; Contact Plating: Tin,Matte; Case Code (Imperial): 0603; Case Code (Metric): 1608; Min Operating Temperature: -55°C; Max Operating Temperature: 155°C; Tolerance: 1%; Composition: Thick Film; Packaging: Tape and Reel; Termination: SMD/SMT; Military Standard: Not; Length: 1.6mm; Height: 0.45mm; Depth: 0.8mm; Radiation Hardening: No; REACH SVHC: No SVHC; Lead Free: Lead Free; ComponentLink2URL: http://documents.rs-components.com/techlib://itc_doclist_GB.htm?stockno=5048928&src-supplier=RSComponents; ComponentLink2Description: http://documents.rs-components.com/techlib://itc_doclist_GB.htm?stockno=5048928&src-supplier=RSComponents; ComponentLink3URL: http://www.yageo.com/documents/recent/PYu-RC0603_51_RoHS_L_4.pdf?src-supplier=Avnet+Europe; ComponentLink3Description: http://www.yageo.com/documents/recent/PYu-RC0603_51_RoHS_L_4.pdf?src-supplier=Avnet+Europe; ComponentLink4URL: http://www.farnell.com/datasheets/2167052.pdf?src-supplier=Element14; ComponentLink4Description: http://www.farnell.com/datasheets/2167052.pdf?src-supplier=Element14; ComponentLink5URL: http://www.farnell.com/datasheets/1868787.pdf?src-supplier=Element14; ComponentLink5Description: http://www.farnell.com/datasheets/1868787.pdf?src-supplier=Element14; ComponentLink6URL: http://www.yageo.com/documents/recent/PYu-RC_Group_51_RoHS_L_2.pdf?src-supplier=Avnet; ComponentLink6Description: http://www.yageo.com/documents/recent/PYu-RC_Group_51_RoHS_L_2.pdf?src-supplier=Avnet; ComponentLink7URL: https://www.verical.com/server-webapp/html/getDatasheet?partID=404327&src-supplier=Verical; ComponentLink7Description: https://www.verical.com/server-webapp/html/getDatasheet?partID=404327&src-supplier=Verical; ComponentLink8URL: http://www.farnell.com/datasheets/443971.pdf?src-supplier=Element14; ComponentLink8Description: http://www.farnell.com/datasheets/443971.pdf?src-supplier=Element14; Supplier Part Number 1: 311-1.00KHRDKR-ND; LCSC Part Number: C22548